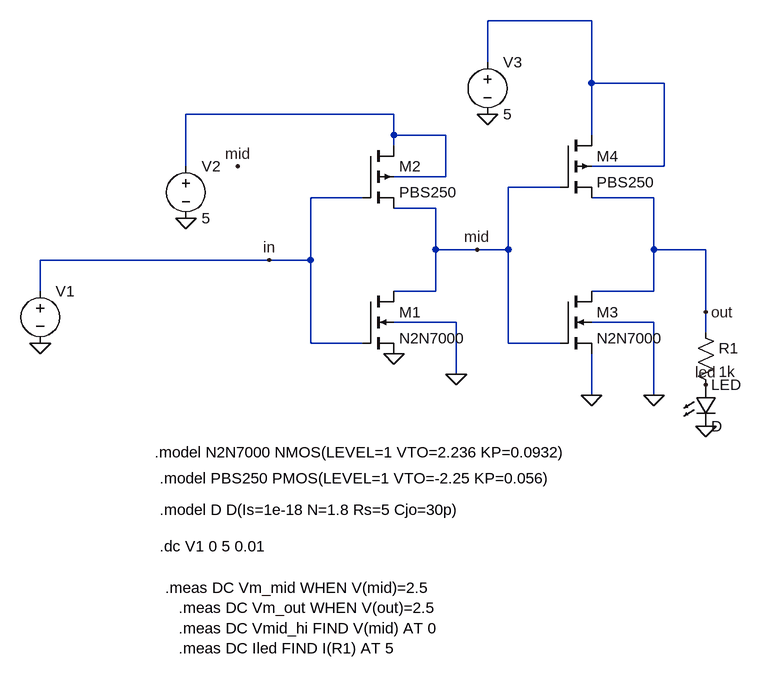
[diagram p0: schematic LTS_E5.asc]
LTS_E5.asc, the LTspice schematic file:
Version 4
SHEET 1 880 748
WIRE 544 -224 384 -224
WIRE 384 -160 384 -224
WIRE 544 -128 544 -224
WIRE 656 -128 544 -128
WIRE 240 -80 -80 -80
WIRE 240 -48 240 -80
WIRE 320 -48 240 -48
WIRE 544 -48 544 -128
WIRE 240 -32 240 -48
WIRE -80 0 -80 -80
WIRE 656 0 656 -128
WIRE 656 0 544 0
WIRE 320 16 320 -48
WIRE 320 16 240 16
WIRE 496 32 416 32
WIRE 192 48 112 48
WIRE 640 48 544 48
WIRE 304 64 240 64
WIRE 304 128 304 64
WIRE 368 128 304 128
WIRE 416 128 416 32
WIRE 416 128 368 128
WIRE 640 128 640 48
WIRE 720 128 640 128
WIRE 48 144 -304 144
WIRE 112 144 112 48
WIRE 112 144 48 144
WIRE -304 192 -304 144
WIRE 304 192 304 128
WIRE 304 192 240 192
WIRE 640 192 640 128
WIRE 640 192 544 192
WIRE 720 224 720 128
WIRE 336 240 240 240
WIRE 640 240 544 240
WIRE 720 256 720 224
WIRE 112 272 112 144
WIRE 192 272 112 272
WIRE 416 272 416 128
WIRE 496 272 416 272
WIRE 336 320 336 240
WIRE 544 352 544 288
WIRE 640 352 640 240
FLAG 720 400 0
FLAG 240 288 0
FLAG -80 80 0
FLAG 336 320 0
FLAG 720 224 out
FLAG 48 144 in
FLAG -304 272 0
FLAG 720 336 led
FLAG 384 -80 0
FLAG 544 352 0
FLAG 640 352 0
FLAG 368 128 mid
FLAG 0 0 mid
SYMBOL nmos4 192 192 R0
SYMATTR InstName M1
SYMATTR Value N2N7000
SYMBOL pmos4 192 -32 R0
SYMATTR InstName M2
SYMATTR Value PBS250
SYMBOL voltage -304 176 R0
WINDOW 123 0 0 Left 0
WINDOW 39 0 0 Left 0
WINDOW 3 24 44 Left 2
SYMATTR Value ""
SYMATTR InstName V1
SYMBOL res 704 240 R0
SYMATTR InstName R1
SYMATTR Value 1k
SYMBOL LED 704 336 R0
SYMATTR InstName LED
SYMBOL voltage -80 -16 R0
WINDOW 123 0 0 Left 0
WINDOW 39 0 0 Left 0
SYMATTR InstName V2
SYMATTR Value 5
SYMBOL nmos4 496 192 R0
SYMATTR InstName M3
SYMATTR Value N2N7000
SYMBOL pmos4 496 -48 R0
SYMATTR InstName M4
SYMATTR Value PBS250
SYMBOL voltage 384 -176 R0
WINDOW 123 0 0 Left 0
WINDOW 39 0 0 Left 0
SYMATTR InstName V3
SYMATTR Value 5
TEXT -128 440 Left 2 !.model N2N7000 NMOS(LEVEL=1 VTO=2.236 KP=0.0932)
TEXT -120 480 Left 2 !.model PBS250 PMOS(LEVEL=1 VTO=-2.25 KP=0.056)
TEXT -120 528 Left 2 !.model D D(Is=1e-18 N=1.8 Rs=5 Cjo=30p)
TEXT -120 584 Left 2 !.dc V1 0 5 0.01
TEXT -112 648 Left 2 !.meas DC Vm_mid WHEN V(mid)=2.5\n   .meas DC Vm_out WHEN V(out)=2.5\n   .meas DC Vmid_hi FIND V(mid) AT 0\n   .meas DC Iled FIND I(R1) AT 5

The netlist it stands for:
* LTS_E5.asc
M1 mid in 0 0 N2N7000
M2 N002 in mid N002 PBS250
V1 in 0
R1 out led 1k
D§LED led 0 D
V2 N002 0 5
M3 out mid 0 0 N2N7000
M4 N001 mid out N001 PBS250
V3 N001 0 5
.model D D
.lib standard.dio
.model NMOS NMOS
.model PMOS PMOS
.lib standard.mos
.model N2N7000 NMOS(LEVEL=1 VTO=2.236 KP=0.0932)
.model PBS250 PMOS(LEVEL=1 VTO=-2.25 KP=0.056)
.model D D(Is=1e-18 N=1.8 Rs=5 Cjo=30p)
.dc V1 0 5 0.01
.meas DC Vm_mid WHEN V(mid)=2.5
   .meas DC Vm_out WHEN V(out)=2.5
   .meas DC Vmid_hi FIND V(mid) AT 0
   .meas DC Iled FIND I(R1) AT 5
.backanno
.end

* Results of the author's LTspice run, read from the files saved beside the schematic
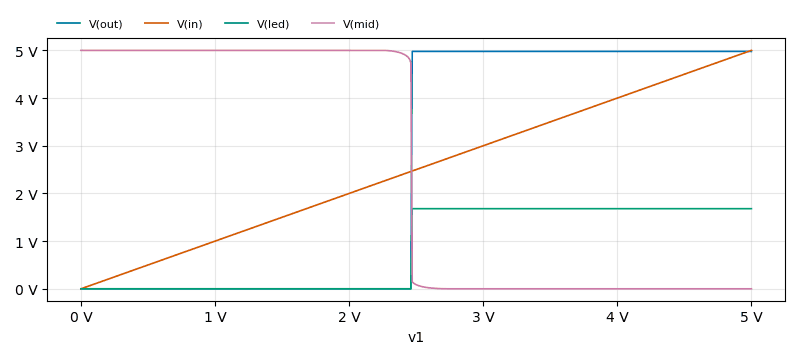
[diagram p1: DC transfer characteristic of LTS_E5.asc, plotted from the saved traces]
* DC transfer characteristic, 1 run:
*   V(out): 38.86 pV at v1=0 V, 4.978 V at v1=5 V, min 38.86 pV, max 4.978 V
*   V(in): 0 V at v1=0 V, 5 V at v1=5 V, min 0 V, max 5 V
*   V(led): 38.86 pV at v1=0 V, 1.68 V at v1=5 V, min 38.86 pV, max 1.681 V
*   V(mid): 5 V at v1=0 V, 38.86 pV at v1=5 V, min -14.77 nV, max 5 V
* From the log:
*   vm_mid: v(mid)=2.5 AT 2.46487
*   vm_out: v(out)=2.5 AT 2.46502
*   vmid_hi: v(mid)=5 at 0
*   iled: i(r1)=0.00329842 at 5